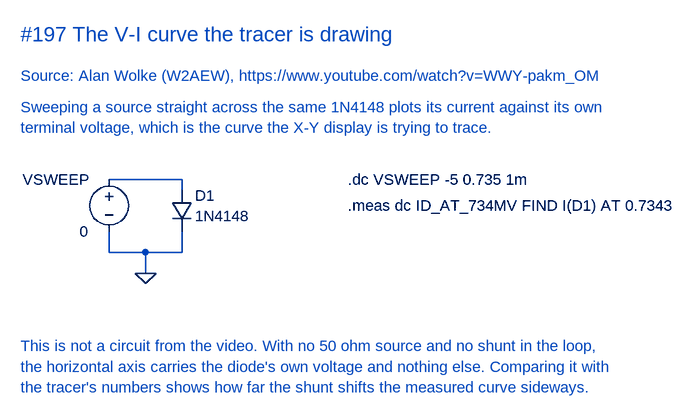
[diagram p0: schematic Diode V-I curve.asc]
Diode V-I curve.asc, the LTspice schematic file:
Version 4
SHEET 1 1200 760
WIRE 272 240 384 240
WIRE 384 240 384 256
WIRE 272 320 272 352
WIRE 384 320 384 352
WIRE 272 352 384 352
WIRE 328 352 328 384
FLAG 328 384 0
SYMBOL voltage 272 224 R0
WINDOW 0 -32 16 Right 2
WINDOW 3 -32 96 Right 2
SYMATTR InstName VSWEEP
SYMATTR Value 0
SYMBOL diode 368 256 R0
WINDOW 0 36 8 Left 2
WINDOW 3 36 40 Left 2
SYMATTR InstName D1
SYMATTR Value 1N4148
TEXT 136 16 Left 3 ;#197 The V-I curve the tracer is drawing
TEXT 136 80 Left 2 ;Source: Alan Wolke (W2AEW), https://www.youtube.com/watch?v=WWY-pakm_OM
TEXT 136 128 Left 2 ;Sweeping a source straight across the same 1N4148 plots its current against its own
TEXT 136 160 Left 2 ;terminal voltage, which is the curve the X-Y display is trying to trace.
TEXT 640 240 Left 2 !.dc VSWEEP -5 0.735 1m
TEXT 640 280 Left 2 !.meas dc ID_AT_734MV FIND I(D1) AT 0.7343
TEXT 136 496 Left 2 ;This is not a circuit from the video. With no 50 ohm source and no shunt in the loop,
TEXT 136 528 Left 2 ;the horizontal axis carries the diode's own voltage and nothing else. Comparing it with
TEXT 136 560 Left 2 ;the tracer's numbers shows how far the shunt shifts the measured curve sideways.

The netlist it stands for:
* Diode V-I curve.asc
VSWEEP N001 0 0
D1 N001 0 1N4148
.model D D
.lib standard.dio
* #197 The V-I curve the tracer is drawing
* Source: Alan Wolke (W2AEW), https://www.youtube.com/watch?v=WWY-pakm_OM
* Sweeping a source straight across the same 1N4148 plots its current against its own
* terminal voltage, which is the curve the X-Y display is trying to trace.
.dc VSWEEP -5 0.735 1m
.meas dc ID_AT_734MV FIND I(D1) AT 0.7343
* This is not a circuit from the video. With no 50 ohm source and no shunt in the loop,
* the horizontal axis carries the diode's own voltage and nothing else. Comparing it with
* the tracer's numbers shows how far the shunt shifts the measured curve sideways.
.backanno
.end